# Altium schematic sheet wire_style.SchDoc
size 254 x 203 mm
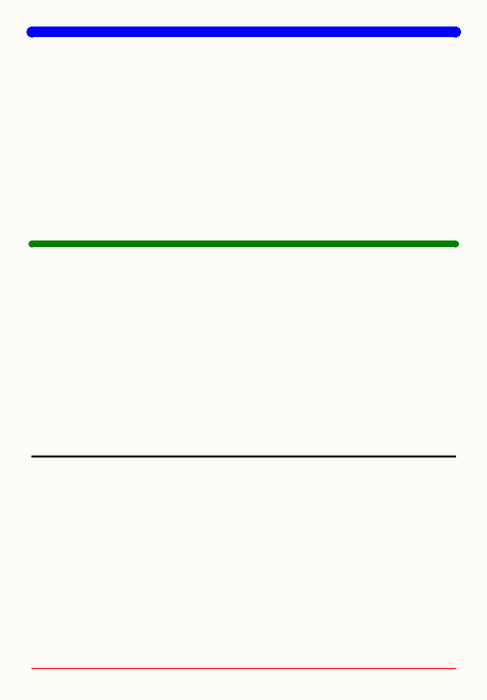
[diagram p0: wire_style.SchDoc]